# Altium project Tracker-NB-IOT-v1.1.PrjPcb (part 2 of 3)
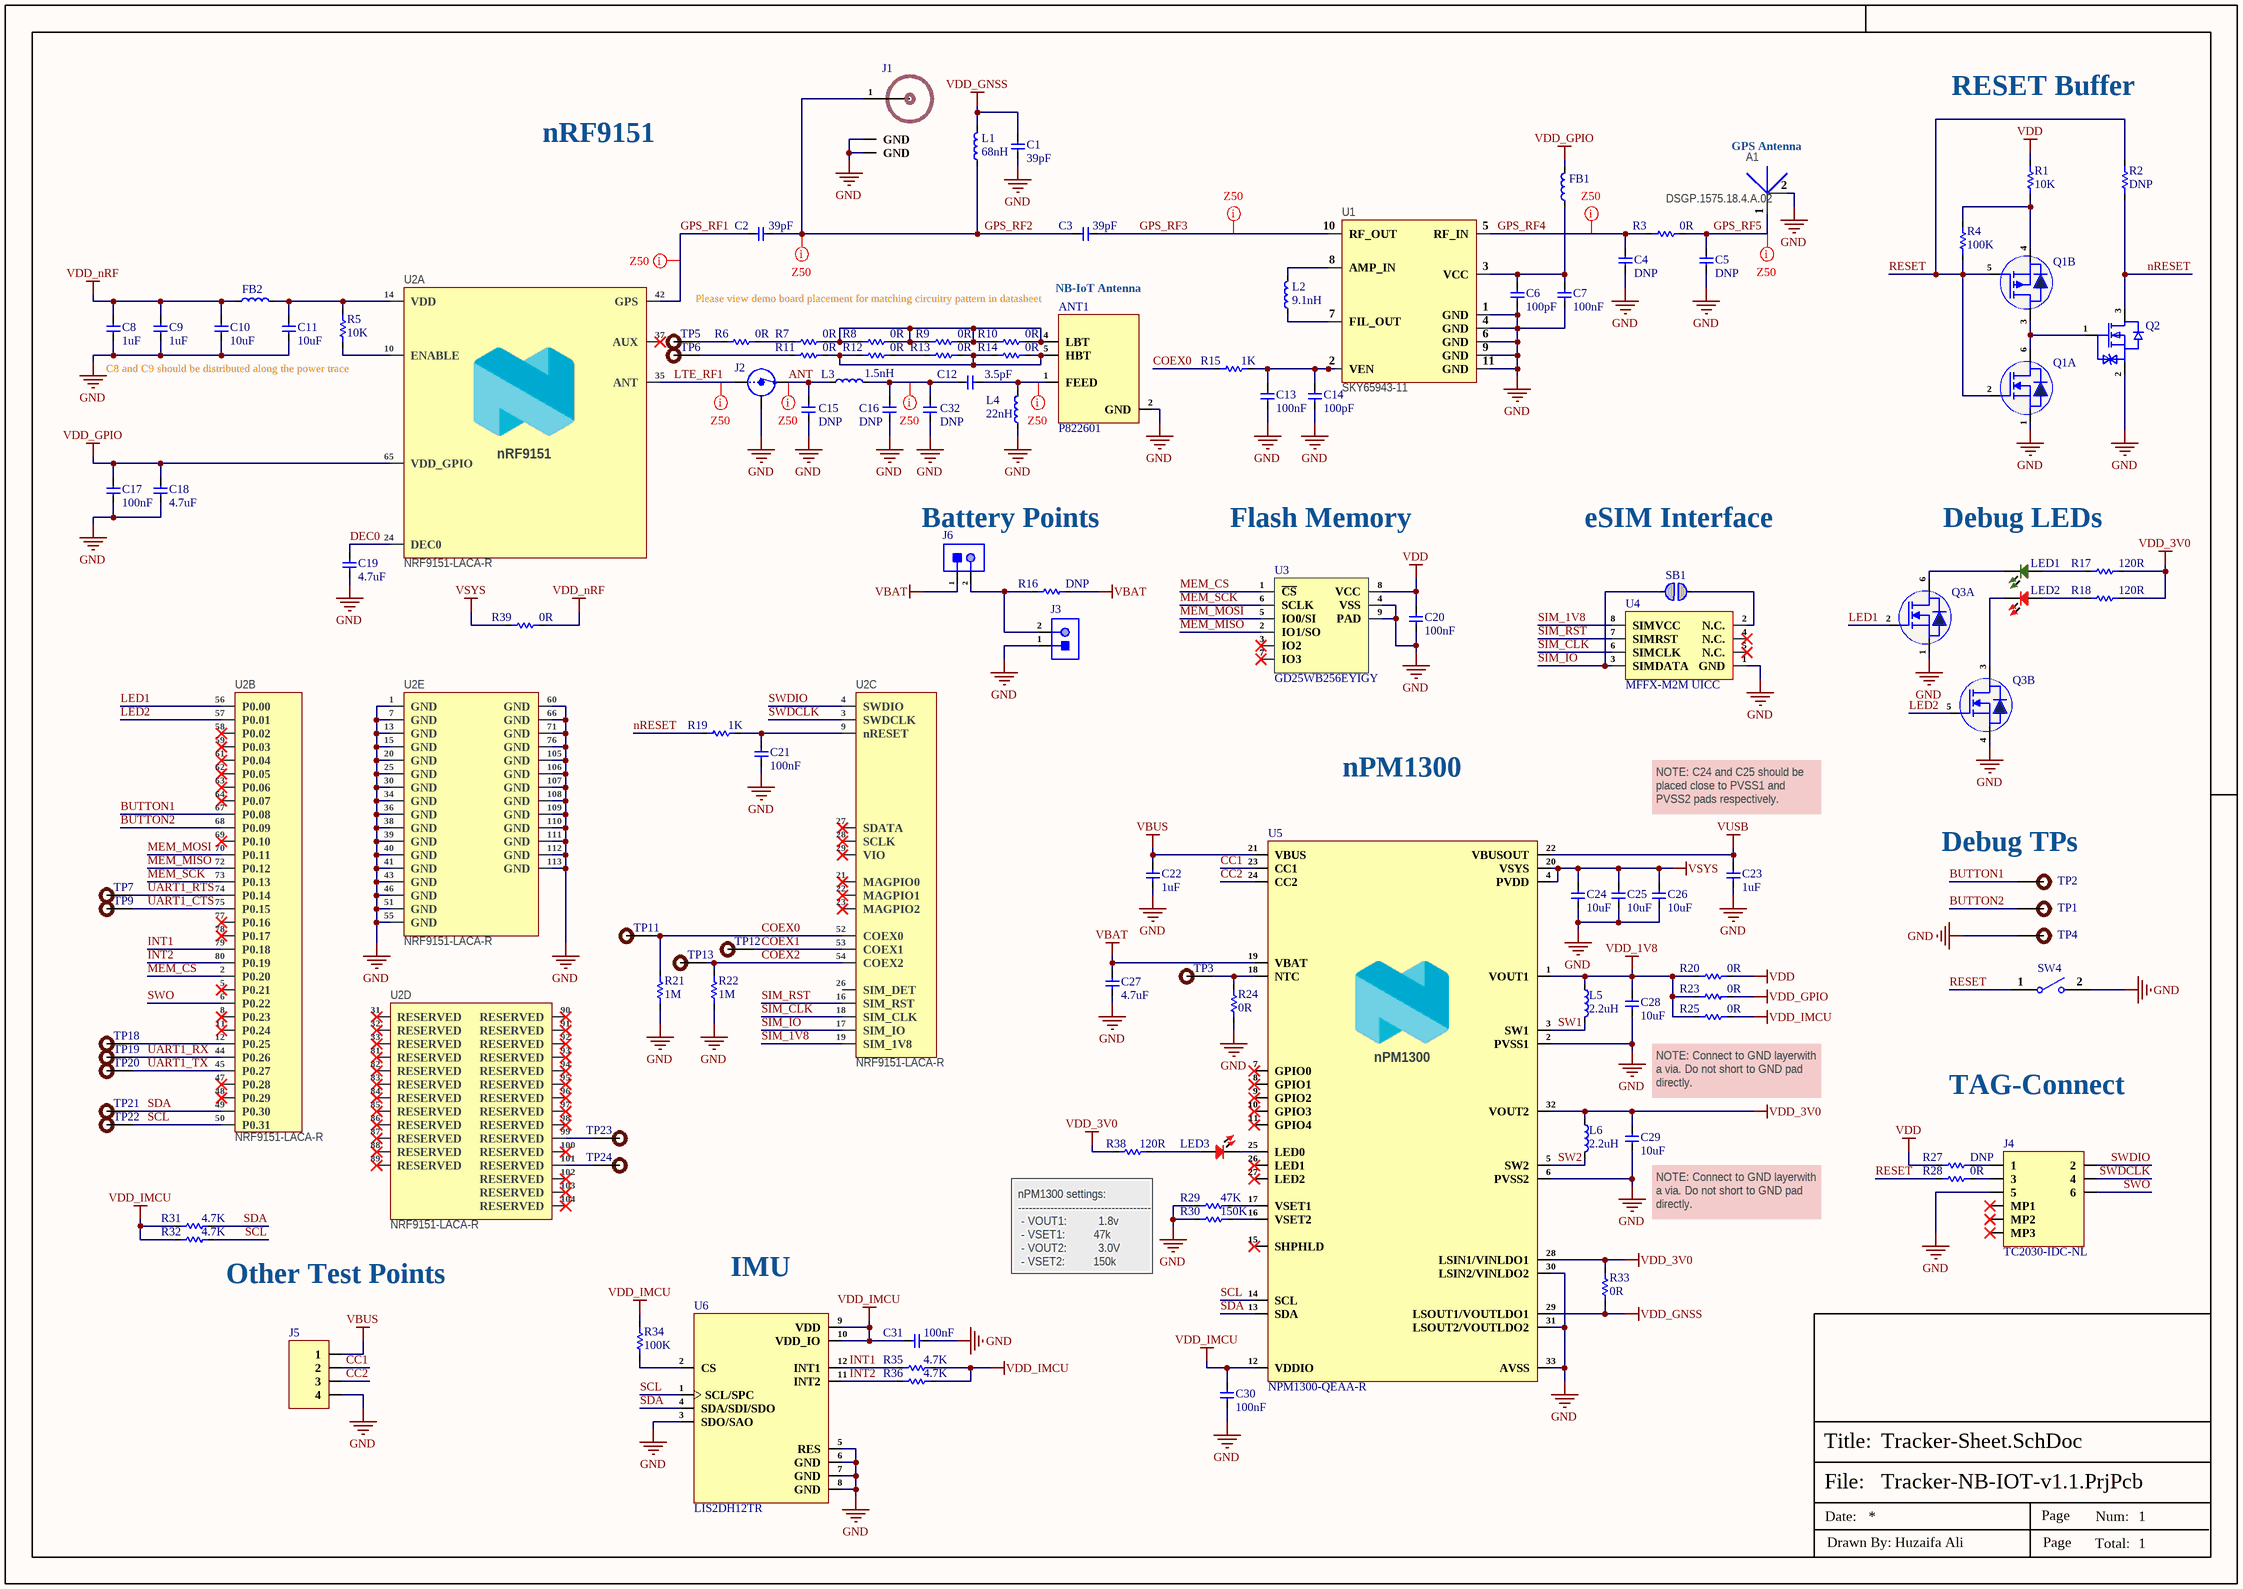
[diagram p1: Tracker-Sheet.SchDoc]

## Sheet Tracker-Sheet.SchDoc (continued)
### Library data of the parts
A1 = DSGP.1575.18.4.A.02: GPS SMT PATCH ANTENNA; Manufacturer: Taoglas; Manufacturer Part Number: DSGP.1575.18.4.C.02; Part number NEMS: 100700073; Component Status: Active; ComponentLink1URL: https://www.taoglas.com/datasheets/DSGP.1575.18.4.A.02.pdf; ComponentLink1Description: Datasheet; ComponentLink2URL: https://www.digikey.com/product-detail/en/taoglas-limited/DSGP.1575.18.4.A.02/931-1511-1-ND/8275289; ComponentLink2Description: Supplier link; Author: rubr; PartId: 100700073; Item Type: ANTENNA
ANT1 = P822601: RF ANT 700MHZ/750MHZ FLAT BAR; Manufacturer: AVX; Item Type: RF Antennas; Number of Bands: 3NUMBER; Frequency: 2.7GHz; Gain: 3.4dB; Impedance: 50R; Power Rating: 2W; Supplier: Digikey; Manufacturer Part Number: P822601; RoHS: Yes; Stock: 7895; Pricing: 1=5.7, 10=3.826, 25=3.3392, 100=2.7938 (USD); Min Operating Temperature: -40°C; Max Operating Temperature: 85°C; Clock Frequency: 2.7GHz; Height: 3.5mm; ComponentLink1URL: http://www.farnell.com/datasheets/2620174.pdf?src-supplier=Farnell; ComponentLink1Description: http://www.farnell.com/datasheets/2620174.pdf?src-supplier=Farnell; ComponentLink2URL: http://www.farnell.com/datasheets/2620174.pdf?src-supplier=Newark; ComponentLink2Description: http://www.farnell.com/datasheets/2620174.pdf?src-supplier=Newark; ComponentLink3URL: http://www.farnell.com/datasheets/2620174.pdf?src-supplier=Element14; ComponentLink3Description: http://www.farnell.com/datasheets/2620174.pdf?src-supplier=Element14; ComponentLink4URL: https://datasheet.octopart.com/P822601-KYOCERA-AVX-datasheet-165822267.pdf?src-supplier=Future+Electronics; ComponentLink4Description: https://datasheet.octopart.com/P822601-KYOCERA-AVX-datasheet-165822267.pdf?src-supplier=Future+Electronics
C1-C5 = CC0402FRNPO9BN390: CAP CER 39PF 50V C0G/NPO 0402; Manufacturer: Yageo; Item Type: Capacitor; Supplier: Future Electronics; Supplier Part Number: 7829161; Manufacturer Part Number: CC0402FRNPO9BN390; RoHS: Yes; Category: Ceramic Capacitors; Stock: 40000; Pricing: 10000=0.0077, 30000=0.0074, 50000=0.0072, 150000=0.0069, 250000=0.0067 (USD); ComponentLink1URL: https://datasheet.ciiva.com/26936/getdatasheetpartid-403444-26936051.pdf?src-supplier=Verical; ComponentLink1Description: https://datasheet.ciiva.com/26936/getdatasheetpartid-403444-26936051.pdf?src-supplier=Verical; ComponentLink2URL: https://datasheet.ciiva.com/11587/upy-gp-np0-16v-to-50v-8-11587062.pdf?src-supplier=Avnet; ComponentLink2Description: https://datasheet.ciiva.com/11587/upy-gp-np0-16v-to-50v-8-11587062.pdf?src-supplier=Avnet; LCSC Part Number: C327068
C6 C14 = CC0201GRNPO9BN101: CAP CER 100PF 50V C0G/NPO 0201; Manufacturer: Yageo; Item Type: Capacitors; Supplier: Digikey; LCSC Part Number: C541242; Manufacturer Part Number: CC0201GRNPO9BN101; RoHS: No; Stock: 97329; Pricing: 1=0.1, 10=0.027, 50=0.0156, 100=0.0122, 500=0.00916, 1000=0.00719, 2500=0.00654, 5000=0.00602 (USD)
C7 C13 C17 C20 C21 C30 C31 = CC0201KRX5R6BB104: CAP CER 0.1UF 10V X5R 0201; Manufacturer: Yageo; Tolerance: 10%; Supplier 1: Mouser; Manufacturer Part Number: CC0201KRX5R6BB104; RoHS: Yes; Category: Ceramic Capacitors; Stock 1: 824403; Pricing 1: 1=0.10000, 10=0.02400, 50=0.02400, 100=0.01900, 1000=0.01100, 10000=0.00900 (USD); Mount: Surface Mount; Case/Package: 0201; Case Code (Imperial): 0201; Case Code (Metric): 0603; Weight: 6E-06oz; Min Operating Temperature: -55°C; Max Operating Temperature: 85°C; Capacitance: 100nF; Dielectric: X5R; Voltage Rating (DC): 10V; Packaging: Tape and Reel; Termination: SMD/SMT; Resistor Type: Ceramic; Voltage Rating: 10V; Series: CC; Construction: Flat; Length: 0.6mm; Width: 0.012inch; Height: 0.3mm; Thickness: 0.013inch; Depth: 0.3mm; Radiation Hardening: No; Lead Free: Lead Free; Halogen Free: Halogen Free; RoHS Compliant: Yes; ComponentLink1URL: https://datasheet.ciiva.com/11587/upy-gphc-x5r-4v-to-50v-12-11587190.pdf?src-supplier=Avnet; ComponentLink1Description: https://datasheet.ciiva.com/11587/upy-gphc-x5r-4v-to-50v-12-11587190.pdf?src-supplier=Avnet; Supplier Part Number 1: 603-CC201KRX5R6BB104; LCSC Part Number: C190183
C8 C9 C22 C23 = CC0201MRX5R6BB105: CAP CER 1UF 10V X5R 0201; Manufacturer: Yageo; Item Type: Capacitor; Supplier: Digi-Key; Supplier Part Number: 311-3474-1-ND; Manufacturer Part Number: CC0201MRX5R6BB105; RoHS: Yes; Category: Ceramic Capacitors; Stock: 772400; Pricing: 1=0.19, 10=0.135, 50=0.0764, 100=0.0633, 500=0.04436, 1000=0.03672, 2500=0.03418, 5000=0.03127 (USD); ComponentLink1URL: https://datasheet.octopart.com/CC0201MRX5R6BB105-Yageo-datasheet-158238148.pdf?src-supplier=Farnell; ComponentLink1Description: https://datasheet.octopart.com/CC0201MRX5R6BB105-Yageo-datasheet-158238148.pdf?src-supplier=Farnell; ComponentLink2URL: http://www.yageo.com/documents/recent/UPY-GPHC_X5R_4V-to-50V_25.pdf?src-supplier=Digi-Key; ComponentLink2Description: http://www.yageo.com/documents/recent/UPY-GPHC_X5R_4V-to-50V_25.pdf?src-supplier=Digi-Key; ComponentLink3URL: https://datasheet.octopart.com/CC0201MRX5R6BB105-Yageo-datasheet-137700082.pdf?src-supplier=Future+Electronics; ComponentLink3Description: https://datasheet.octopart.com/CC0201MRX5R6BB105-Yageo-datasheet-137700082.pdf?src-supplier=Future+Electronics; LCSC Part Number: C605210
C10 C11 C24-C26 C28 C29 = GRM188Z71A106KA73D: CAP CER 10UF 10V X7R 0603; Manufacturer: Murata; Item Type: Capacitor; Material: 4241ConductorMaterial; Tolerance: 10%; Supplier: Mouser; LCSC Part Number: C2959727; Manufacturer Part Number: GRM188Z71A106KA73D; RoHS: Yes; Stock: 390983; Pricing: 1=0.36, 10=0.155, 50=0.155, 100=0.104, 1000=0.094, 10000=0.065 (USD); Case/Package: 345Case; Min Operating Temperature: -55°C; Max Operating Temperature: 125°C; Value: 10uF; Voltage Rating: 10V; Length: 1.6mm; Width: 800um; Height: 1mm; Thickness: 800um; RoHS Compliant: Yes; ComponentLink1URL: https://datasheet.octopart.com/GRM188Z71A106KA73D-Murata-datasheet-165579666.pdf?src-supplier=TME; ComponentLink1Description: https://datasheet.octopart.com/GRM188Z71A106KA73D-Murata-datasheet-165579666.pdf?src-supplier=TME
C12 = GJM0335C1H3R5BB01D: CAP CER 3.5PF 50V C0G/NP0 0201; Manufacturer: Murata; Item Type: Capacitor; Supplier: Mouser; Supplier Part Number: 81-GJM0335C1H3R5BB1D; Manufacturer Part Number: GJM0335C1H3R5BB01D; RoHS: Yes; Stock: 31816; Pricing: 1=0.1, 10=0.032, 50=0.032, 100=0.019, 1000=0.015, 10000=0.012 (USD); ComponentLink1URL: https://search.murata.co.jp/Ceramy/image/img/A01X/G101/ENG/GJM0335C1H3R5BB01-01.pdf?src-supplier=Digikey; ComponentLink1Description: https://search.murata.co.jp/Ceramy/image/img/A01X/G101/ENG/GJM0335C1H3R5BB01-01.pdf?src-supplier=Digikey
C15 C16 C32 = GCM0335C1E560JA16D: CAP CER 56PF 25V C0G/NP0 0201; Manufacturer: Murata; Item Type: Capacitors; Supplier: Mouser; Manufacturer Part Number: GCM0335C1E560JA16D; RoHS: Yes; Stock: 29000; Pricing: 1=0.1, 10=0.014, 50=0.014, 100=0.008, 1000=0.007, 10000=0.005 (USD); LCSC Part Number: C5119324
C18 C19 C27 = CC0402KRX5R6BB475: CAP CER 4.7UF 10V X5R 0402; Manufacturer: Yageo; Tolerance: 10%; Supplier 1: Farnell; Manufacturer Part Number: CC0402KRX5R6BB475; RoHS: Yes; Category: Ceramic Capacitors; Stock 1: 20000; Pricing 1: 10000=0.02310, 50000=0.02100 (GBP); Mount: Surface Mount; Case/Package: 0402; Case Code (Imperial): 0402; Case Code (Metric): 1005; Min Operating Temperature: -55°C; Max Operating Temperature: 85°C; Packaging: Cut Tape; Capacitance: 4.7uF; Voltage Rating: 10V; RoHS Compliant: Yes; ComponentLink1URL: http://www.yageo.com/documents/recent/UPY-GPHC_X5R_4V-to-50V_25.pdf?src-supplier=Digi-Key; ComponentLink1Description: http://www.yageo.com/documents/recent/UPY-GPHC_X5R_4V-to-50V_25.pdf?src-supplier=Digi-Key; Supplier Part Number 1: 3871698; LCSC Part Number: C326586
FB1 = BLM15EX121SN1D: FERRITE BEAD 120 OHM 0402 1LN; Manufacturer: Murata; Item Type: Ferrite Beads; Number of Lines: 1; Max Current Rating: 1.8A; Supplier: Mouser; LCSC Part Number: C426325; Manufacturer Part Number: BLM15EX121SN1D; RoHS: Yes; Stock: 26843; Pricing: 1=0.17, 10=0.089, 50=0.089, 100=0.062, 1000=0.045, 10000=0.039 (USD); Mounting Technology: Surface Mount; Case/Package: 0402; Case Code (Imperial): 0402; Case Code (Metric): 1005; Min Operating Temperature: -55°C; Max Operating Temperature: 125°C; Packaging: Cut Tape; Series: EMIFIL®, BLM15; RoHS Compliant: Yes; ComponentLink1URL: https://www.murata.com/en-us/products/productdata/8796750970910/ENFA0023.pdf?src-supplier=Digikey; ComponentLink1Description: https://www.murata.com/en-us/products/productdata/8796750970910/ENFA0023.pdf?src-supplier=Digikey
FB2 = BLM18SD220SN1D: FERRITE BEAD 22 OHM 0603 1LN; Manufacturer: Murata; Item Type: Ferrite Beads; Number of Lines: 1; Max Current Rating: 6A; Supplier: Mouser; Supplier Part Number: 81-BLM18SD220SN1D; Manufacturer Part Number: BLM18SD220SN1D; RoHS: Yes; Stock: 11187; Pricing: 1=0.16, 10=0.093, 50=0.093, 100=0.064, 1000=0.047, 10000=0.04 (USD); Mounting Technology: Surface Mount; Case/Package: 0603; Case Code (Imperial): 0603; Case Code (Metric): 1608; Min Operating Temperature: -55°C; Max Operating Temperature: 125°C; Packaging: Cut Tape; Series: BLM; RoHS Compliant: Yes; ComponentLink1URL: https://www.murata.com/en-us/products/productdata/8796738650142/ENFA0003.pdf?src-supplier=Digikey; ComponentLink1Description: https://www.murata.com/en-us/products/productdata/8796738650142/ENFA0003.pdf?src-supplier=Digikey
J1 = U.FL-R-SMT-1(80): CONN U.FL RCPT STR 50 OHM SMD; Manufacturer: Hirose; Item Type: UFL Connector; Supplier 1: Future Electronics; Manufacturer Part Number: U.FL-R-SMT-1(80); Stock 1: 1272; Pricing 1: 1=1.07, 500=0.785, 1500=0.74, 2500=0.72, 5000=0.695 (USD); Case/Package: SMD/SMT; Package Quantity: 10000; Packaging: Tape and Reel; Lead Free: Lead Free; ComponentLink1URL: https://www.hirose.com/product/en/download_file/key_name/U.FL-R-SMT-1%2880%29/category/Specification%20Sheet/doc_file_id/37638/?file_category_id=9&item_id=03310472280&is_series=&src-supplier=Digi-Key; ComponentLink1Description: https://www.hirose.com/product/en/download_file/key_name/U.FL-R-SMT-1%2880%29/category/Specification%20Sheet/doc_file_id/37638/?file_category_id=9&item_id=03310472280&is_series=&src-supplier=Digi-Key; ComponentLink2URL: http://www.mouser.com/ds/2/185/U.FL_catalog-939761.pdf?src-supplier=Mouser; ComponentLink2Description: http://www.mouser.com/ds/2/185/U.FL_catalog-939761.pdf?src-supplier=Mouser; Supplier Part Number 1: U.FL-R-SMT-1(80)-CUTT; LCSC Part Number: C88374
J2 = MM8130-2600RA2: CONN SWF RCPT STR 50 OHM SMD; Manufacturer: Murata; Item Type: RF / Coaxial Connectors; Supplier: Future Electronics; LCSC Part Number: C167503; Manufacturer Part Number: MM8130-2600RA2; RoHS: Yes; Stock: 262000; Pricing: 2000=0.121, 6000=0.118, 8000=0.117, 20000=0.114, 30000=0.111 (USD); ComponentLink1URL: https://datasheet.ciiva.com/13541/mm8130-260020datasheet-202944-13541575.pdf?src-supplier=Mouser; ComponentLink1Description: https://datasheet.ciiva.com/13541/mm8130-260020datasheet-202944-13541575.pdf?src-supplier=Mouser; ComponentLink2URL: https://datasheet.ciiva.com/14157/04615200-1-14157602.pdf?src-supplier=Distrelec; ComponentLink2Description: https://datasheet.ciiva.com/14157/04615200-1-14157602.pdf?src-supplier=Distrelec; ComponentLink3URL: https://datasheet.ciiva.com/16465/l0391e-16465766.pdf?src-supplier=Future+Electronics; ComponentLink3Description: https://datasheet.ciiva.com/16465/l0391e-16465766.pdf?src-supplier=Future+Electronics
J3 = X6511WV-02H-C60D30: Gold 250V 3A Straight Square Pins 2.5mm 2P 260℃ 6mm -40℃~+105℃ 3mm 2.54mm Plugin Black Brass 1x2P Plugin,P=2.54mm Pin Headers ROHS; Manufacturer: XKB; Item Type: Male Header; Manufacturer Part Number: X6511WV-02H-C60D30; Package: Plugin,P=2.54mm; LCSC Part Number: C706874; ComponentLink1Description: LCSC; ComponentLink1URL: https://www.lcsc.com/product-detail/Pin-Headers_XKB-Connectivity-X6511WV-02H-C60D30_C706874.html
J5 = POGO Connector 4 Pin: Pogo Pad 2.5mm 4 Pin; Item Type: Pogo Connector; Manufacturer Part Number: POGO Connector 4 Pin
J6 = 1.27-1*2P: 3A Direct Insert Policy 1.7mm 2P 3mm -55℃~+105℃ 2.5mm 1.27mm Single Row Black Brass 1x2P Plugin,P=1.27mm Pin Headers ROHS; Manufacturer: BOOMELE(BOOM Precision Elec); Item Type: Male; Manufacturer Part Number: 1.27-1*2P; Package: Plugin,P=1.27mm; LCSC Part Number: C703015; ComponentLink1Description: LCSC; ComponentLink1URL: https://www.lcsc.com/product-detail/Pin-Headers_BOOMELE-Boom-Precision-Elec-1-27-1-2P_C703015.html
L1 = LQW15AN68NG00D: FIXED IND 68NH 140MA 1.96OHM SMD; Manufacturer: Murata; Item Type: Inductor; Core Material: Non-Magnetic,Air,Ferrite; Tolerance: 2%; DC Resistance (DCR): 1.96R; Shielding: Unshielded; Q Factor: 20; Self Resonant Frequency: 2.5GHz; Test Frequency: 100MHz; Current: 570mA; Supplier: Future Electronics; LCSC Part Number: C108965; Manufacturer Part Number: LQW15AN68NG00D; RoHS: Yes; Stock: 10000; Pricing: 10000=0.0443, 20000=0.0432, 30000=0.0426, 40000=0.0422, 50000=0.0408 (USD); Mounting Technology: Surface Mount; Case/Package: 0402; Pins: 2; Weight: 2.8E-05oz; Case Code (Metric): 1005; Case Code (Imperial): 0402; Min Operating Temperature: -55°C; Max Operating Temperature: 125°C; Value: 68nH; Max DC Current: 140mA; Package Quantity: 1; Packaging: Tape and Reel; Inductance Tolerance: 2%; Termination: SMD/SMT; DC Current: 140mA; Series: LQW15A_00; RMS Current (Irms): 140mA; ESR: 1.96R; Length: 1mm; Width: 0.5mm; Height: 0.5mm; Depth: 0.6mm; Radiation Hardening: No; Reach SVHC Compliant: No; Military Standard: Not; Lead Free: Lead Free; RoHS Compliant: Yes; ComponentLink1URL: https://datasheet.ciiva.com/11799/0900766b8090d800-11799373.pdf?src-supplier=Rs; ComponentLink1Description: https://datasheet.ciiva.com/11799/0900766b8090d800-11799373.pdf?src-supplier=Rs; ComponentLink2URL: https://datasheet.ciiva.com/36857/460962-36857115.pdf?src-supplier=Element14; ComponentLink2Description: https://datasheet.ciiva.com/36857/460962-36857115.pdf?src-supplier=Element14; ComponentLink3URL: https://datasheet.ciiva.com/6709/l0075s0080lqw15a-00-6709896.pdf?src-supplier=Digikey; ComponentLink3Description: https://datasheet.ciiva.com/6709/l0075s0080lqw15a-00-6709896.pdf?src-supplier=Digikey; ComponentLink4URL: https://datasheet.ciiva.com/6709/l0075s0080lqw15a-00-6709895.pdf?src-supplier=Digikey; ComponentLink4Description: https://datasheet.ciiva.com/6709/l0075s0080lqw15a-00-6709895.pdf?src-supplier=Digikey; ComponentLink5URL: https://datasheet.ciiva.com/6709/l0075s0080lqw15a-00-6709898.pdf?src-supplier=Digikey; ComponentLink5Description: https://datasheet.ciiva.com/6709/l0075s0080lqw15a-00-6709898.pdf?src-supplier=Digikey; ComponentLink6URL: https://datasheet.ciiva.com/8508/l0075s0080lqw15a-00-8508445.pdf?src-supplier=Avnet; ComponentLink6Description: https://datasheet.ciiva.com/8508/l0075s0080lqw15a-00-8508445.pdf?src-supplier=Avnet
L2 = LQW15AN9N1G00D: FIXED IND 9.1NH 540MA 0.14OHM SM; Manufacturer: Murata; Item Type: nductors; Supplier: Future Electronics; LCSC Part Number: C113122; Manufacturer Part Number: LQW15AN9N1G00D; RoHS: Yes; Stock: 200000; Pricing: 10000=0.0438, 20000=0.0428, 30000=0.0422, 40000=0.0418, 50000=0.0404 (USD); ComponentLink1URL: https://datasheet.ciiva.com/11799/0900766b8090d800-11799088.pdf?src-supplier=Rs; ComponentLink1Description: https://datasheet.ciiva.com/11799/0900766b8090d800-11799088.pdf?src-supplier=Rs; ComponentLink2URL: https://datasheet.ciiva.com/6709/l0075s0080lqw15a-00-6709884.pdf?src-supplier=Digikey; ComponentLink2Description: https://datasheet.ciiva.com/6709/l0075s0080lqw15a-00-6709884.pdf?src-supplier=Digikey; ComponentLink3URL: https://datasheet.ciiva.com/6709/l0075s0080lqw15a-00-6709886.pdf?src-supplier=Digikey; ComponentLink3Description: https://datasheet.ciiva.com/6709/l0075s0080lqw15a-00-6709886.pdf?src-supplier=Digikey; ComponentLink4URL: https://datasheet.ciiva.com/4978/product-4978396.pdf?src-supplier=Mouser; ComponentLink4Description: https://datasheet.ciiva.com/4978/product-4978396.pdf?src-supplier=Mouser; ComponentLink5URL: https://datasheet.ciiva.com/16455/l0075s0080lqw15a-00-16455836.pdf?src-supplier=Future+Electronics; ComponentLink5Description: https://datasheet.ciiva.com/16455/l0075s0080lqw15a-00-16455836.pdf?src-supplier=Future+Electronics
L3 = LQP03HQ1N5B02D: FIXED IND 1.5NH 1A 50 MOHM SMD; Manufacturer: Murata; Item Type: Inductor; Q Factor: 20NUMBER; Value: 50mR; Supplier: Mouser; LCSC Part Number: C2041489; Manufacturer Part Number: LQP03HQ1N5B02D; RoHS: Yes; Stock: 37991; Pricing: 1=0.16, 10=0.104, 50=0.104, 100=0.081, 1000=0.065, 10000=0.057 (USD); RMS Current (Irms): 1A; ESR: 50mR; Height: 420um; ComponentLink1URL: http://www.farnell.com/datasheets/2616670.pdf?src-supplier=Farnell; ComponentLink1Description: http://www.farnell.com/datasheets/2616670.pdf?src-supplier=Farnell; ComponentLink2URL: https://search.murata.co.jp/Ceramy/image/img/P02/JELF243C-0021.pdf?src-supplier=Digikey; ComponentLink2Description: https://search.murata.co.jp/Ceramy/image/img/P02/JELF243C-0021.pdf?src-supplier=Digikey; ComponentLink3URL: http://search.murata.co.jp/Ceramy/image/img/P02/JELF243C-0021.pdf?src-supplier=Digikey; ComponentLink3Description: http://search.murata.co.jp/Ceramy/image/img/P02/JELF243C-0021.pdf?src-supplier=Digikey; ComponentLink4URL: https://datasheet.octopart.com/LQP03HQ1N5B02D-Murata-datasheet-68295820.pdf?src-supplier=Future+Electronics; ComponentLink4Description: https://datasheet.octopart.com/LQP03HQ1N5B02D-Murata-datasheet-68295820.pdf?src-supplier=Future+Electronics; ComponentLink5URL: http://www.farnell.com/datasheets/2616670.pdf?src-supplier=Newark; ComponentLink5Description: http://www.farnell.com/datasheets/2616670.pdf?src-supplier=Newark
L4 = LQP03HQ22NH02D: FIXED IND 22NH 250MA 820MOHM SMD; Manufacturer: Murata; Item Type: Inductors; Supplier: Mouser; LCSC Part Number: C1329450; Manufacturer Part Number: LQP03HQ22NH02D; RoHS: Yes; Stock: 18723; Pricing: 1=0.11, 10=0.072, 50=0.072, 100=0.056, 1000=0.046, 10000=0.045 (USD); ComponentLink1URL: https://datasheet.octopart.com/LQP03HQ22NH02D-Murata-datasheet-140317290.pdf?src-supplier=Farnell; ComponentLink1Description: https://datasheet.octopart.com/LQP03HQ22NH02D-Murata-datasheet-140317290.pdf?src-supplier=Farnell; ComponentLink2URL: https://search.murata.co.jp/Ceramy/image/img/P02/JELF243C-0021.pdf?src-supplier=Digikey; ComponentLink2Description: https://search.murata.co.jp/Ceramy/image/img/P02/JELF243C-0021.pdf?src-supplier=Digikey; ComponentLink3URL: http://search.murata.co.jp/Ceramy/image/img/P02/JELF243C-0021.pdf?src-supplier=Digikey; ComponentLink3Description: http://search.murata.co.jp/Ceramy/image/img/P02/JELF243C-0021.pdf?src-supplier=Digikey; ComponentLink4URL: https://datasheet.octopart.com/LQP03HQ22NH02D-Murata-datasheet-68295820.pdf?src-supplier=Future+Electronics; ComponentLink4Description: https://datasheet.octopart.com/LQP03HQ22NH02D-Murata-datasheet-68295820.pdf?src-supplier=Future+Electronics; ComponentLink5URL: https://datasheet.octopart.com/LQP03HQ22NH02D-Murata-datasheet-142046015.pdf?src-supplier=Arrow.cn; ComponentLink5Description: https://datasheet.octopart.com/LQP03HQ22NH02D-Murata-datasheet-142046015.pdf?src-supplier=Arrow.cn
L5 L6 = CIGT201610EH2R2MNE: FIXED IND 2.2UH 2.5A 87MOHM SMD; Manufacturer: Samsung; Item Type: Inductor; Core Material: Metal,Composite; Tolerance: 20%; Saturation Current: 2.9A; Shielding: Unshielded; DC Resistance (DCR): 87mR; Test Frequency: 1MHz; Supplier: Arrow Electronics; Supplier Part Number: CIGT201610EH2R2MNE; Manufacturer Part Number: CIGT201610EH2R2MNE; RoHS: Yes; Stock: 6000; Pricing: 60000=0.0753, 99000=0.0745 (USD); Mounting Technology: Surface Mount; Case/Package: 0806; Case Code (Imperial): 0806; Case Code (Metric): 2016; Min Operating Temperature: -40°C; Max Operating Temperature: 125°C; Packaging: Cut Tape; Value: 2.2uH; Series: CIGT; RoHS Compliant: Yes; ComponentLink1URL: http://www.samsungsem.com/kr/support/product-search/inductor/CIGT201610EH2R2MNE.jsp?src-supplier=Digikey; ComponentLink1Description: http://www.samsungsem.com/kr/support/product-search/inductor/CIGT201610EH2R2MNE.jsp?src-supplier=Digikey
LED1 = XZVG68W-2: LED GREEN CLEAR CHIP SMD; Manufacturer: SunLED; Lens Color: Colorless; Luminous Intensity: 49mcd; Test Current: 20mA; Viewing Angle: 120°; Dominant Wavelength: 570nm; Forward Voltage: 2.1V; Manufacturer Part Number: XZVG68W-2; Item Type: LED; ComponentLink1Description: http://www.sunledusa.com/products/spec/XZVG68W-2.pdf?src-supplier=Digi-Key; ComponentLink1URL: http://www.sunledusa.com/products/spec/XZVG68W-2.pdf?src-supplier=Digi-Key; Supplier 1: Digi-Key; Stock 1: 4185; Pricing 1: 1=0.5, 10=0.36, 100=0.16, 500=0.112, 1000=0.092 (USD); Mount: Surface Mount; Case/Package: 0402; Color: Green; Case Code (Metric): 1005; Case Code (Imperial): 0402; Packaging: Tape and Reel; Lens Transparency: Clear; Length: 1mm; Height: 0.6mm; Width: 0.5mm; ComponentLink2URL: https://www.sunledusa.com/products/spec/XZVG68W-2.pdf?src-supplier=Digi-Key; ComponentLink2Description: https://www.sunledusa.com/products/spec/XZVG68W-2.pdf?src-supplier=Digi-Key; Supplier Part Number 1: 1497-1219-6-ND
LED2 LED3 = XZMDK68W-2: LED RED CLEAR CHIP SMD; Manufacturer: SunLED; Lens Color: Colorless; Luminous Intensity: 69mcd; Test Current: 20mA; Viewing Angle: 120°; Dominant Wavelength: 630nm; Forward Voltage: 1.95V; Manufacturer Part Number: XZMDK68W-2; Item Type: LED; ComponentLink1Description: http://www.sunledusa.com/products/spec/XZMDK68W-2.pdf?src-supplier=Digi-Key; ComponentLink1URL: http://www.sunledusa.com/products/spec/XZMDK68W-2.pdf?src-supplier=Digi-Key; Supplier 1: Digi-Key; Stock 1: 69539; Pricing 1: 1=0.43, 10=0.306, 100=0.136, 500=0.0952, 1000=0.0782 (USD); Mount: Surface Mount; Case/Package: 0402; Color: Red; Case Code (Metric): 1005; Case Code (Imperial): 0402; Packaging: Tape and Reel; Lens Transparency: Clear; Length: 1mm; Height: 0.6mm; Width: 0.5mm; ComponentLink2URL: https://www.sunledusa.com/products/spec/XZMDK68W-2.pdf?src-supplier=Digi-Key; ComponentLink2Description: https://www.sunledusa.com/products/spec/XZMDK68W-2.pdf?src-supplier=Digi-Key; Supplier Part Number 1: 1497-1174-6-ND
Q1 = DMC2400UV-7: MOSFET N/P-CH 20V SOT563; Manufacturer: Diodes; Item Type: MOSFETs; Max Power Dissipation: 450mW; Rds On Max: 480mR; Input Capacitance: 37.1pF; Continuous Drain Current (ID): 1.03A; Turn-Off Delay Time: 13.74ns; Turn-On Delay Time: 4.06ns; FET Type: N and P-Channel; Drain-source On Resistance-Max: 970mR; Supplier: Future Electronics; LCSC Part Number: 8027555; Manufacturer Part Number: DMC2400UV-7; RoHS: Yes; Stock: 207000; Pricing: 3000=0.0517, 9000=0.0497, 12000=0.0492, 30000=0.0476, 45000=0.046 (USD); Mounting Technology: Surface Mount; Case/Package: SOT-563; Pins: 6; Min Operating Temperature: -55°C; Max Operating Temperature: 150°C; Packaging: Tape and Reel; Drain to Source Voltage (Vdss): 20V; Series: -; Length: 1.7mm; Width: 1.25mm; Height: 0.6mm; Radiation Hardening: No; RoHS Compliant: Yes; Lead Free: Lead Free; Reach SVHC Compliant: Yes; ComponentLink1URL: https://datasheet.ciiva.com/11176/dmc2400uv-11176335.pdf?src-supplier=Avnet; ComponentLink1Description: https://datasheet.ciiva.com/11176/dmc2400uv-11176335.pdf?src-supplier=Avnet
Q2 = RV2C010UNT2L: MOSFET N-CH 20V 1A DFN1006-3; Manufacturer: Rohm; Item Type: MOSFETs; Drain to Source Resistance: 340mR; Supplier: Mouser; LCSC Part Number: C570828; Manufacturer Part Number: RV2C010UNT2L; RoHS: Yes; Stock: 16470; Pricing: 1=0.42, 10=0.261, 50=0.261, 100=0.123, 1000=0.086, 10000=0.073 (USD); ComponentLink1URL: http://www.mouser.com/ds/2/348/rv2c010un-e-1139137.pdf?src-supplier=Mouser; ComponentLink1Description: http://www.mouser.com/ds/2/348/rv2c010un-e-1139137.pdf?src-supplier=Mouser; ComponentLink2URL: http://www.farnell.com/datasheets/1945594.pdf?src-supplier=Farnell; ComponentLink2Description: http://www.farnell.com/datasheets/1945594.pdf?src-supplier=Farnell; ComponentLink3URL: https://www.rohm.com/datasheet/RV2C010UN/rv2c010un-e?src-supplier=Digikey; ComponentLink3Description: https://www.rohm.com/datasheet/RV2C010UN/rv2c010un-e?src-supplier=Digikey; ComponentLink4URL: http://rohmfs.rohm.com/en/techdata_basic/transistor/taping/VML1006_T2L_taping.pdf?src-supplier=Digikey; ComponentLink4Description: http://rohmfs.rohm.com/en/techdata_basic/transistor/taping/VML1006_T2L_taping.pdf?src-supplier=Digikey; ComponentLink5URL: http://rohmfs.rohm.com/en/products/databook/datasheet/discrete/transistor/mosfet/rv2c010unt2l.pdf?src-supplier=Avnet; ComponentLink5Description: http://rohmfs.rohm.com/en/products/databook/datasheet/discrete/transistor/mosfet/rv2c010unt2l.pdf?src-supplier=Avnet; ComponentLink6URL: https://datasheet.octopart.com/RV2C010UNT2L-Rohm-datasheet-57364635.pdf?src-supplier=Element14; ComponentLink6Description: https://datasheet.octopart.com/RV2C010UNT2L-Rohm-datasheet-57364635.pdf?src-supplier=Element14
Q3 = UM6X1NA-TP: MOSFET 2N-CH 30V 0.5A SOT563; Manufacturer: MCC; Supplier: Digikey; Supplier Part Number: 353-UM6X1NA-TPCT-ND; Manufacturer Part Number: UM6X1NA-TP; RoHS: No; Item Type: Mosfet; Stock: 4780; Pricing: 1=0.29, 10=0.203, 100=0.1284, 500=0.08108, 1000=0.06082 (USD)
R1 R5 = RC0201FR-0710KL: RES SMD 10K OHM 1% 1/20W 0201; Manufacturer: Yageo; Item Type: Resistor; Manufacturer Part Number: RC0201FR-0710KL; Package: 0201; ComponentLink7Description: LCSC; ComponentLink7URL: https://www.lcsc.com/product-detail/Chip-Resistor-Surface-Mount_YAGEO-RC0201FR-0710KL_C106225.html; LCSC Part Number: C106225
R2 R27 = RC0201JR-070RL: RES SMD 0 OHM JUMPER 1/20W 0201; Manufacturer: Yageo; Resistance: 0R; Power Rating: 50mW; Tolerance: 5%; Voltage Rating: 25V; Supplier 1: Digi-Key; Manufacturer Part Number: RC0201JR-070RL; RoHS: Yes; Category: Chip SMD Resistors; Stock 1: 11079; Pricing 1: 1=0.10000, 10=0.03600, 25=0.02640, 50=0.02000, 100=0.01480, 250=0.01128, 500=0.00904, 1000=0.00665, 5000=0.00477 (USD); Case/Package: 0201; Contact Plating: Tin,Matte; Case Code (Metric): 0603; Case Code (Imperial): 0201; Weight: 6E-06oz; Size Code: 0201; Min Operating Temperature: -55°C; Max Operating Temperature: 125°C; Resistor Type: Thick Film; Packaging: Tape and Reel; Package Quantity: 10000; Number of Terminations: 2; Termination: SMD/SMT; Max Power Dissipation: 50mW; Voltage Rating (DC): 25V; Features: Moisture Resistant; Series: RC; Construction: Rectangular; Resistance Tolerance: 5%; Length: 0.6mm; Width: 0.012inch; Height: 0.01inch; Depth: 0.3mm; Radiation Hardening: No; RoHS Compliant: Yes; REACH SVHC: Unknown; Military Standard: Not; Lead Free: Lead Free; ComponentLink1URL: https://datasheet.ciiva.com/7672/1563626-7672247.pdf?src-supplier=Element14; ComponentLink1Description: https://datasheet.ciiva.com/7672/1563626-7672247.pdf?src-supplier=Element14; ComponentLink2URL: https://datasheet.ciiva.com/7660/1421516-7660808.pdf?src-supplier=Element14; ComponentLink2Description: https://datasheet.ciiva.com/7660/1421516-7660808.pdf?src-supplier=Element14; ComponentLink3URL: https://datasheet.ciiva.com/7672/1563626-7672248.pdf?src-supplier=Element14; ComponentLink3Description: https://datasheet.ciiva.com/7672/1563626-7672248.pdf?src-supplier=Element14; ComponentLink4URL: https://datasheet.ciiva.com/16855/pyu-rc0201-51-rohs-l-8-16855994.pdf?src-supplier=Avnet+Europe; ComponentLink4Description: https://datasheet.ciiva.com/16855/pyu-rc0201-51-rohs-l-8-16855994.pdf?src-supplier=Avnet+Europe; ComponentLink5URL: https://datasheet.ciiva.com/28419/pyu-rc0201-51-rohs-l-8-28419660.pdf?src-supplier=Avnet+Europe; ComponentLink5Description: https://datasheet.ciiva.com/28419/pyu-rc0201-51-rohs-l-8-28419660.pdf?src-supplier=Avnet+Europe; ComponentLink6URL: https://datasheet.ciiva.com/46391/1421516-46391340.pdf?src-supplier=Element14; ComponentLink6Description: https://datasheet.ciiva.com/46391/1421516-46391340.pdf?src-supplier=Element14; ComponentLink7URL: https://datasheet.ciiva.com/8896/pyu-rc0201-51-rohs-l-8-8896143.pdf?src-supplier=Avnet; ComponentLink7Description: https://datasheet.ciiva.com/8896/pyu-rc0201-51-rohs-l-8-8896143.pdf?src-supplier=Avnet; Supplier Part Number 1: 311-0.0NCT-ND; LCSC Part Number: C106228
R3 R20 R23 R25 R39 = RC0402FR-070RL: RES 0 OHM JUMPER 1/16W 0402; Manufacturer: Yageo; Item Type: Resistors; Tolerance: 1%; Power Rating: 62.5mW; Voltage Rating: 50V; Temperature Coefficient: 200ppm/°C; Max Power Dissipation: 63mW; Supplier 1: Mouser; Manufacturer Part Number: RC0402FR-070RL; RoHS: Yes; Stock 1: 8556842; Pricing 1: 1=0.10000, 10=0.01400, 50=0.01400, 100=0.00600, 1000=0.00300, 5000=0.00200, 10000=0.00100 (USD); Mount: Surface Mount; Case/Package: 0402; Contact Plating: Tin,Matte; Case Code (Imperial): 0402; Case Code (Metric): 1005; Size Code: 0402; Min Operating Temperature: -55°C; Max Operating Temperature: 155°C; Resistance: 0R; Resistor Type: Thick Film; Packaging: Tape and Reel; Termination: SMD/SMT; Features: Moisture Resistant; Series: RC; Number of Terminations: 2; Length: 1mm; Width: 0.5mm; Height: 0.35mm; Radiation Hardening: No; Lead Free: Lead Free; RoHS Compliant: Yes; ComponentLink1URL: https://datasheet.ciiva.com/8896/pyu-rc0402-51-rohs-l-6-8896149.pdf?src-supplier=Avnet; ComponentLink1Description: https://datasheet.ciiva.com/8896/pyu-rc0402-51-rohs-l-6-8896149.pdf?src-supplier=Avnet; ComponentLink2URL: https://datasheet.ciiva.com/16790/pyu-rc0402-51-rohs-l-6-r-16790444.pdf?src-supplier=Future+Electronics; ComponentLink2Description: https://datasheet.ciiva.com/16790/pyu-rc0402-51-rohs-l-6-r-16790444.pdf?src-supplier=Future+Electronics; Supplier Part Number 1: 603-RC0402FR-070RL; LCSC Part Number: C106231
R4 R34 = RC0201FR-07100KL: RES 100K OHM 1% 1/20W 0201; Manufacturer: Yageo; Resistance: 100kR; Temperature Coefficient: 200ppm/°C; Power Rating: 50mW; Voltage Rating: 25V; Item Type: Resistor; Supplier 1: Digi-Key; Manufacturer Part Number: RC0201FR-07100KL; RoHS: Yes; Category: Chip SMD Resistors; Stock 1: 6740592; Pricing 1: 1=0.10000, 10=0.03900, 100=0.01570, 1000=0.00705, 2500=0.00612, 5000=0.00506 (USD); Case/Package: 0201; Number of Pins: 2; Contact Plating: Tin,Matte; Case Code (Imperial): 0201; Case Code (Metric): 0603; Size Code: 0201; Min Operating Temperature: -55°C; Max Operating Temperature: 125°C; Tolerance: 1%; Resistor Type: Thick Film; Packaging: Tape and Reel; Package Quantity: 10000; Termination: SMD/SMT; Number of Terminations: 2; Max Power Dissipation: 50mW; Voltage Rating (DC): 25V; Features: Moisture Resistant; Series: RC; Resistance Tolerance: 1%; Construction: Rectangular; Length: 0.024inch; Width: 0.012inch; Height: 0.01inch; Depth: 0.3mm; REACH SVHC: No SVHC; Military Standard: Not; Lead Free: Lead Free; RoHS Compliant: Yes; ComponentLink1URL: https://datasheet.ciiva.com/7660/1421516-7660806.pdf?src-supplier=Element14; ComponentLink1Description: https://datasheet.ciiva.com/7660/1421516-7660806.pdf?src-supplier=Element14; ComponentLink2URL: https://datasheet.ciiva.com/22698/1563626-22698495.pdf?src-supplier=Element14; ComponentLink2Description: https://datasheet.ciiva.com/22698/1563626-22698495.pdf?src-supplier=Element14; ComponentLink3URL: https://datasheet.ciiva.com/46391/1421516-46391338.pdf?src-supplier=Element14; ComponentLink3Description: https://datasheet.ciiva.com/46391/1421516-46391338.pdf?src-supplier=Element14; ComponentLink4URL: https://datasheet.ciiva.com/2493/pyu-r-int-thick-7-2493770.pdf?src-supplier=Digi-Key; ComponentLink4Description: https://datasheet.ciiva.com/2493/pyu-r-int-thick-7-2493770.pdf?src-supplier=Digi-Key; ComponentLink5URL: https://datasheet.ciiva.com/2493/pyu-r-int-thick-7-2493771.pdf?src-supplier=Digi-Key; ComponentLink5Description: https://datasheet.ciiva.com/2493/pyu-r-int-thick-7-2493771.pdf?src-supplier=Digi-Key; ComponentLink6URL: https://datasheet.ciiva.com/2493/pyu-r-int-thick-7-2493769.pdf?src-supplier=Digi-Key; ComponentLink6Description: https://datasheet.ciiva.com/2493/pyu-r-int-thick-7-2493769.pdf?src-supplier=Digi-Key; ComponentLink7URL: https://datasheet.ciiva.com/26829/getdatasheetpartid-420441-26829850.pdf?src-supplier=Verical; ComponentLink7Description: https://datasheet.ciiva.com/26829/getdatasheetpartid-420441-26829850.pdf?src-supplier=Verical; Supplier Part Number 1: 311-100KMCT-ND; LCSC Part Number: C106224
R6-R14 R24 R28 R33 = RC0201JR-070RL: RES SMD 0 OHM JUMPER 1/20W 0201; Manufacturer: Yageo; Power Rating: 50mW; Tolerance: 5%; Voltage Rating: 25V; Supplier 1: Digi-Key; Manufacturer Part Number: RC0201JR-070RL; RoHS: Yes; Category: Chip SMD Resistors; Stock 1: 11079; Pricing 1: 1=0.10000, 10=0.03600, 25=0.02640, 50=0.02000, 100=0.01480, 250=0.01128, 500=0.00904, 1000=0.00665, 5000=0.00477 (USD); Case/Package: 0201; Contact Plating: Tin,Matte; Case Code (Metric): 0603; Case Code (Imperial): 0201; Weight: 6E-06oz; Size Code: 0201; Min Operating Temperature: -55°C; Max Operating Temperature: 125°C; Resistor Type: Thick Film; Resistance: 0R; Packaging: Tape and Reel; Package Quantity: 10000; Number of Terminations: 2; Termination: SMD/SMT; Max Power Dissipation: 50mW; Voltage Rating (DC): 25V; Features: Moisture Resistant; Series: RC; Construction: Rectangular; Resistance Tolerance: 5%; Length: 0.6mm; Width: 0.012inch; Height: 0.01inch; Depth: 0.3mm; Radiation Hardening: No; RoHS Compliant: Yes; REACH SVHC: Unknown; Military Standard: Not; Lead Free: Lead Free; ComponentLink1URL: https://datasheet.ciiva.com/7672/1563626-7672247.pdf?src-supplier=Element14; ComponentLink1Description: https://datasheet.ciiva.com/7672/1563626-7672247.pdf?src-supplier=Element14; ComponentLink2URL: https://datasheet.ciiva.com/7660/1421516-7660808.pdf?src-supplier=Element14; ComponentLink2Description: https://datasheet.ciiva.com/7660/1421516-7660808.pdf?src-supplier=Element14; ComponentLink3URL: https://datasheet.ciiva.com/7672/1563626-7672248.pdf?src-supplier=Element14; ComponentLink3Description: https://datasheet.ciiva.com/7672/1563626-7672248.pdf?src-supplier=Element14; ComponentLink4URL: https://datasheet.ciiva.com/16855/pyu-rc0201-51-rohs-l-8-16855994.pdf?src-supplier=Avnet+Europe; ComponentLink4Description: https://datasheet.ciiva.com/16855/pyu-rc0201-51-rohs-l-8-16855994.pdf?src-supplier=Avnet+Europe; ComponentLink5URL: https://datasheet.ciiva.com/28419/pyu-rc0201-51-rohs-l-8-28419660.pdf?src-supplier=Avnet+Europe; ComponentLink5Description: https://datasheet.ciiva.com/28419/pyu-rc0201-51-rohs-l-8-28419660.pdf?src-supplier=Avnet+Europe; ComponentLink6URL: https://datasheet.ciiva.com/46391/1421516-46391340.pdf?src-supplier=Element14; ComponentLink6Description: https://datasheet.ciiva.com/46391/1421516-46391340.pdf?src-supplier=Element14; ComponentLink7URL: https://datasheet.ciiva.com/8896/pyu-rc0201-51-rohs-l-8-8896143.pdf?src-supplier=Avnet; ComponentLink7Description: https://datasheet.ciiva.com/8896/pyu-rc0201-51-rohs-l-8-8896143.pdf?src-supplier=Avnet; Supplier Part Number 1: 311-0.0NCT-ND; LCSC Part Number: C106228
R15 R19 = RC0201FR-071KL: RES 1K OHM 1% 1/20W 0201; Manufacturer: Yageo; Value: 1kR; Temperature Coefficient: 200ppm/°C; Power Rating: 50mW; Voltage Rating: 25V; Item Type: Resistor; Supplier: Digi-Key; Supplier Part Number: 311-1KMCT-ND; Manufacturer Part Number: RC0201FR-071KL; RoHS: Yes; Category: Chip SMD Resistors; Stock: 5606340; Pricing: 1=0.1, 10=0.027, 50=0.0172, 100=0.0143, 500=0.00988, 1000=0.00854, 5000=0.00629 (USD); Case/Package: 0201; Contact Plating: Tin,Matte; Case Code (Metric): 0603; Case Code (Imperial): 0201; Min Operating Temperature: -55°C; Max Operating Temperature: 125°C; Tolerance: 1%; Resistor Type: Thick Film; Package Quantity: 10000; Packaging: Tape and Reel; Number of Terminations: 2; Termination: SMD/SMT; Max Power Dissipation: 50mW; Working Voltage: 25V; Features: Moisture Resistant; Series: RC; Resistance Tolerance: 1%; Technology: THICK FILM; Construction: Rectangular; Voltage Rating (DC): 25V; Length: 0.024inch; Width: 0.012inch; Height: 0.01inch; Depth: 0.3mm; Military Standard: Not; RoHS Compliant: Yes; Reach SVHC Compliant: Unknown; Lead Free: 5697LeadFree; ComponentLink1URL: https://datasheet.ciiva.com/7672/1563626-7672204.pdf?src-supplier=Element14; ComponentLink1Description: https://datasheet.ciiva.com/7672/1563626-7672204.pdf?src-supplier=Element14; ComponentLink2URL: https://datasheet.ciiva.com/22698/1563626-22698505.pdf?src-supplier=Element14; ComponentLink2Description: https://datasheet.ciiva.com/22698/1563626-22698505.pdf?src-supplier=Element14; ComponentLink3URL: https://datasheet.ciiva.com/29721/pyu-r-int-thick-7-29721196.pdf?src-supplier=Digi-Key; ComponentLink3Description: https://datasheet.ciiva.com/29721/pyu-r-int-thick-7-29721196.pdf?src-supplier=Digi-Key; ComponentLink4URL: https://datasheet.ciiva.com/29721/pyu-r-int-thick-7-29721195.pdf?src-supplier=Digi-Key; ComponentLink4Description: https://datasheet.ciiva.com/29721/pyu-r-int-thick-7-29721195.pdf?src-supplier=Digi-Key; ComponentLink5URL: https://datasheet.ciiva.com/8896/pyu-rc0201-51-rohs-l-8-8896174.pdf?src-supplier=Avnet; ComponentLink5Description: https://datasheet.ciiva.com/8896/pyu-rc0201-51-rohs-l-8-8896174.pdf?src-supplier=Avnet; LCSC Part Number: C138165
R16 = RC0402FR-070RL: RES 0 OHM JUMPER 1/16W 0402; Manufacturer: Yageo; Item Type: Resistors; Resistance: 0R; Tolerance: 1%; Power Rating: 62.5mW; Voltage Rating: 50V; Temperature Coefficient: 200ppm/°C; Max Power Dissipation: 63mW; Supplier 1: Mouser; Manufacturer Part Number: RC0402FR-070RL; RoHS: Yes; Stock 1: 8556842; Pricing 1: 1=0.10000, 10=0.01400, 50=0.01400, 100=0.00600, 1000=0.00300, 5000=0.00200, 10000=0.00100 (USD); Mount: Surface Mount; Case/Package: 0402; Contact Plating: Tin,Matte; Case Code (Imperial): 0402; Case Code (Metric): 1005; Size Code: 0402; Min Operating Temperature: -55°C; Max Operating Temperature: 155°C; Resistor Type: Thick Film; Packaging: Tape and Reel; Termination: SMD/SMT; Features: Moisture Resistant; Series: RC; Number of Terminations: 2; Length: 1mm; Width: 0.5mm; Height: 0.35mm; Radiation Hardening: No; Lead Free: Lead Free; RoHS Compliant: Yes; ComponentLink1URL: https://datasheet.ciiva.com/8896/pyu-rc0402-51-rohs-l-6-8896149.pdf?src-supplier=Avnet; ComponentLink1Description: https://datasheet.ciiva.com/8896/pyu-rc0402-51-rohs-l-6-8896149.pdf?src-supplier=Avnet; ComponentLink2URL: https://datasheet.ciiva.com/16790/pyu-rc0402-51-rohs-l-6-r-16790444.pdf?src-supplier=Future+Electronics; ComponentLink2Description: https://datasheet.ciiva.com/16790/pyu-rc0402-51-rohs-l-6-r-16790444.pdf?src-supplier=Future+Electronics; Supplier Part Number 1: 603-RC0402FR-070RL; LCSC Part Number: C106231
R17 R18 R38 = RC0402FR-07120RL: RES 120 OHM 1% 1/16W 0402; Manufacturer: Yageo; Item Type: Resistors; Power Rating: 62.5mW; Voltage Rating: 50V; Temperature Coefficient: 100ppm/°C; Max Power Dissipation: 63mW; Supplier: Future Electronics; Supplier Part Number: 4529079; Manufacturer Part Number: RC0402FR-07120RL; RoHS: Yes; Stock: 150000; Pricing: 10000=0.0012, 100000=0.0011, 300000=0.001, 750000=0.001, 2000000=0.0009 (USD); Lead Free: 5697LeadFree; ComponentLink1URL: https://datasheet.ciiva.com/12667/pyu-rc0402-51-rohs-l-6-r-12667958.pdf?src-supplier=Mouser; ComponentLink1Description: https://datasheet.ciiva.com/12667/pyu-rc0402-51-rohs-l-6-r-12667958.pdf?src-supplier=Mouser; ComponentLink2URL: https://datasheet.ciiva.com/7849/1018594-7849831.pdf?src-supplier=Element14; ComponentLink2Description: https://datasheet.ciiva.com/7849/1018594-7849831.pdf?src-supplier=Element14; LCSC Part Number: C114758; Case/Package: 0402; Case Code (Imperial): 0402; Case Code (Metric): 1005; Min Operating Temperature: -55°C; Max Operating Temperature: 155°C; Package Quantity: 1; Value: 120R; Tolerance: 1%; Packaging: Tape and Reel; Termination: SMD/SMT; Resistor Type: Thick Film; Number of Terminations: 2; Features: Moisture Resistant; Series: RC; Resistance Tolerance: 1%; Construction: Rectangular; Technology: THICK FILM; Voltage Rating (AC): 50V; Length: 0.039inch; Width: 0.02inch; Height: 0.016inch; Depth: 0.5mm; Reach SVHC Compliant: No; Military Standard: Not; RoHS Compliant: Yes
R21 R22 = RC0201FR-071ML: RES 1M OHM 1% 1/20W 0201; Manufacturer: Yageo; Item Type: Resistor; Value: 1MR; Temperature Coefficient: 200ppm/°C; Power Rating: 50mW; Voltage Rating: 25V; Supplier: Avnet; LCSC Part Number: C295786; Manufacturer Part Number: RC0201FR-071ML; RoHS: Yes; Stock: 13025; Pricing: 1=0.104, 25=0.016, 100=0.008, 250=0.007, 1000=0.006 (USD); Case/Package: 0201; Contact Plating: Tin,Matte; Case Code (Imperial): 0201; Case Code (Metric): 0603; Min Operating Temperature: -55°C; Max Operating Temperature: 125°C; Tolerance: 1%; Resistor Type: Thick Film; Packaging: Tape and Reel; Package Quantity: 10000; Termination: SMD/SMT; Number of Terminations: 2; Max Power Dissipation: 50mW; Features: Moisture Resistant; Series: RC; Resistance Tolerance: 1%; Construction: Rectangular; Voltage Rating (DC): 25V; Length: 0.6mm; Width: 0.3mm; Height: 0.01inch; Depth: 0.3mm; Military Standard: Not; RoHS Compliant: Yes; Reach SVHC Compliant: Unknown; Lead Free: 5697LeadFree; ComponentLink1URL: https://datasheet.ciiva.com/29721/pyu-r-int-thick-7-29721005.pdf?src-supplier=Digikey; ComponentLink1Description: https://datasheet.ciiva.com/29721/pyu-r-int-thick-7-29721005.pdf?src-supplier=Digikey; ComponentLink2URL: https://datasheet.ciiva.com/29721/pyu-r-int-thick-7-29721006.pdf?src-supplier=Digikey; ComponentLink2Description: https://datasheet.ciiva.com/29721/pyu-r-int-thick-7-29721006.pdf?src-supplier=Digikey; ComponentLink3URL: https://datasheet.ciiva.com/7672/1563626-7672207.pdf?src-supplier=Element14; ComponentLink3Description: https://datasheet.ciiva.com/7672/1563626-7672207.pdf?src-supplier=Element14; ComponentLink4URL: https://datasheet.ciiva.com/22698/1563626-22698507.pdf?src-supplier=Element14; ComponentLink4Description: https://datasheet.ciiva.com/22698/1563626-22698507.pdf?src-supplier=Element14; ComponentLink5URL: https://datasheet.ciiva.com/25647/pyu-r-int-thick-7-25647311.pdf?src-supplier=Digikey; ComponentLink5Description: https://datasheet.ciiva.com/25647/pyu-r-int-thick-7-25647311.pdf?src-supplier=Digikey
R29 = RT0402BRE0747KL: RES SMD 47K OHM 0.1% 1/16W 0402; Manufacturer: Yageo; Power Rating: 62.5mW; Voltage Rating (DC): 50V; Value: 47kR; Max Power Dissipation: 63mW; Temperature Coefficient: 50ppm/°C; Item Type: Resistor; Supplier: Digikey; Supplier Part Number: YAG4391CT-ND; Manufacturer Part Number: RT0402BRE0747KL; RoHS: Yes; Category: Chip SMD Resistors; Stock: 11654; Pricing: 1=0.16, 10=0.121, 50=0.0958, 100=0.0858, 500=0.06536, 1000=0.05776, 5000=0.0428 (USD); Case/Package: 0402; Case Code (Metric): 3668CaseCodeMetric; Min Operating Temperature: -55°C; Max Operating Temperature: 155°C; Tolerance: 0.1%; Series: RT; Number of Terminations: 2; Voltage Rating: 50V; Length: 1mm; Width: 500um; Height: 350um; Lead Free: Lead Free; RoHS Compliant: Yes; ComponentLink1URL: https://datasheet.octopart.com/RT0402BRE0747KL-Yageo-datasheet-169971040.pdf?src-supplier=Future+Electronics; ComponentLink1Description: https://datasheet.octopart.com/RT0402BRE0747KL-Yageo-datasheet-169971040.pdf?src-supplier=Future+Electronics; ComponentLink2URL: http://www.yageo.com/documents/recent/PYu-RT_1-to-0.01_RoHS_L_9.pdf?src-supplier=Digikey; ComponentLink2Description: http://www.yageo.com/documents/recent/PYu-RT_1-to-0.01_RoHS_L_9.pdf?src-supplier=Digikey; ComponentLink3URL: https://www.yageo.com/upload/media/product/productsearch/datasheet/rchip/PYu-RT_1-to-0.01_RoHS_L_12.pdf?src-supplier=Digikey; ComponentLink3Description: https://www.yageo.com/upload/media/product/productsearch/datasheet/rchip/PYu-RT_1-to-0.01_RoHS_L_12.pdf?src-supplier=Digikey; LCSC Part Number: C853293
R30 = RT0402BRD07150KL: RES 150K OHM 0.1% 1/16W 0402; Manufacturer: Yageo; Item Type: Resistor; Supplier: Future Electronics; Supplier Part Number: 3102901; Manufacturer Part Number: RT0402BRD07150KL; RoHS: Yes; Category: Chip SMD Resistors; Stock: 20000; Pricing: 10000=0.0218, 20000=0.0213, 30000=0.021, 50000=0.0206, 100000=0.0199 (USD); RoHS Compliant: Yes; LCSC Part Number: C852538
R31 R32 R35 R36 = RC0201FR-074K7L: RES 4.7K OHM 1% 1/20W 0201; Manufacturer: Yageo; Item Type: Resistor; Supplier: Future Electronics; Supplier Part Number: 7537285; Manufacturer Part Number: RC0201FR-074K7L; RoHS: Yes; Category: Chip SMD Resistors; Stock: 1610000; Pricing: 10000=0.0014, 50000=0.0013, 250000=0.0013, 750000=0.0012, 2000000=0.0011 (USD); ComponentLink1URL: https://datasheet.ciiva.com/2493/pyu-r-int-thick-7-2493811.pdf?src-supplier=Digi-Key; ComponentLink1Description: https://datasheet.ciiva.com/2493/pyu-r-int-thick-7-2493811.pdf?src-supplier=Digi-Key; ComponentLink2URL: https://datasheet.ciiva.com/2493/pyu-r-int-thick-7-2493812.pdf?src-supplier=Digi-Key; ComponentLink2Description: https://datasheet.ciiva.com/2493/pyu-r-int-thick-7-2493812.pdf?src-supplier=Digi-Key; ComponentLink3URL: https://datasheet.ciiva.com/2493/pyu-r-int-thick-7-2493813.pdf?src-supplier=Digi-Key; ComponentLink3Description: https://datasheet.ciiva.com/2493/pyu-r-int-thick-7-2493813.pdf?src-supplier=Digi-Key; ComponentLink4URL: https://datasheet.ciiva.com/8892/pyu-rc0201-51-rohs-l-8-8892942.pdf?src-supplier=Avnet; ComponentLink4Description: https://datasheet.ciiva.com/8892/pyu-rc0201-51-rohs-l-8-8892942.pdf?src-supplier=Avnet; ComponentLink5URL: https://datasheet.ciiva.com/7672/1563626-7672233.pdf?src-supplier=Element14; ComponentLink5Description: https://datasheet.ciiva.com/7672/1563626-7672233.pdf?src-supplier=Element14; LCSC Part Number: C138135
SB1 = Solder Bridge 0402: Solder Bridge ON; Manufacturer Part Number: Solder Bridge 0402; Item Type: Solder Bridge
SW4 = B3U-1000P: SWITCH TACTILE SPST-NO 0.05A 12V; Manufacturer: Omron; Mechanical Life: 200000Cycles; Operating Force: 1.5N; Throw Configuration: SPST; Current Rating: 50mA; Contact Resistance: 100mR; Illumination Type: Non-Illuminated,Illuminated; Switch Travel: 0.15mm; Switch Function: Off-Mom; Actuator Type: Standard; Actuator Length: 0.4mm; Ratings: Dust Proof,IP40; ComponentLink1URL: http://www.farnell.com/datasheets/60838.pdf?src-supplier=Farnell; ComponentLink1Description: http://www.farnell.com/datasheets/60838.pdf?src-supplier=Farnell; ComponentLink2URL: http://www.farnell.com/datasheets/60838.pdf?src-supplier=Element14; ComponentLink2Description: http://www.farnell.com/datasheets/60838.pdf?src-supplier=Element14; ComponentLink3URL: https://omronfs.omron.com/en_US/ecb/products/pdf/en-b3u.pdf?src-supplier=Digi-Key; ComponentLink3Description: https://omronfs.omron.com/en_US/ecb/products/pdf/en-b3u.pdf?src-supplier=Digi-Key; ComponentLink4URL: http://www.omron.com/ecb/products/pdf/en-b3u.pdf?src-supplier=Digi-Key; ComponentLink4Description: http://www.omron.com/ecb/products/pdf/en-b3u.pdf?src-supplier=Digi-Key; ComponentLink5URL: https://www.distrelec.biz/Web/Downloads/he/et/B3U_eng_datasheet.pdf?mime=application%2Fpdf&src-supplier=Distrelec; ComponentLink5Description: https://www.distrelec.biz/Web/Downloads/he/et/B3U_eng_datasheet.pdf?mime=application%2Fpdf&src-supplier=Distrelec; ComponentLink6URL: http://www.onlinecomponents.com/productFiles/mf-OM/en-b3u.pdf?src-supplier=Onlinecomponents.com; ComponentLink6Description: http://www.onlinecomponents.com/productFiles/mf-OM/en-b3u.pdf?src-supplier=Onlinecomponents.com; Supplier 1: Digi-Key; Manufacturer Part Number: B3U-1000P; Stock 1: 116454; Pricing 1: 1=1, 10=0.961, 25=0.9064, 50=0.7976, 100=0.7251, 250=0.68888, 500=0.67074, 1000=0.52571 (USD); Mount: Surface Mount; Weight: 0.000776oz; Contact Material: Silver; Min Operating Temperature: -25°C; Max Operating Temperature: 70°C; Packaging: Tape and Reel; Voltage Rating (DC): 12V; Package Quantity: 1; Max Current Rating: 50mA; Termination: SMD/SMT; Orientation: Straight; Max Voltage Rating (DC): 12V; Electrical Life: 200000Cycles; Insulation Resistance: 100MR; Contact Current Rating: 50mA; Length: 4mm; Height: 1.2mm; Depth: 2.5mm; Width: 3mm; REACH SVHC: Unknown; Lead Free: Lead Free; ComponentLink7URL: https://www.verical.com/server-webapp/html/getDatasheet?partID=552554&src-supplier=Verical; ComponentLink7Description: https://www.verical.com/server-webapp/html/getDatasheet?partID=552554&src-supplier=Verical; ComponentLink8URL: http://www.farnell.com/datasheets/1685550.pdf?src-supplier=Element14; ComponentLink8Description: http://www.farnell.com/datasheets/1685550.pdf?src-supplier=Element14; ComponentLink9URL: http://www.farnell.com/datasheets/2610940.pdf?src-supplier=Farnell; ComponentLink9Description: http://www.farnell.com/datasheets/2610940.pdf?src-supplier=Farnell; ComponentLink10URL: https://www.alliedelec.com/m/d/4c8a9ef82804fc3c241a13c1e298fd73.pdf?src-supplier=Allied+Electronics; ComponentLink10Description: https://www.alliedelec.com/m/d/4c8a9ef82804fc3c241a13c1e298fd73.pdf?src-supplier=Allied+Electronics; Supplier Part Number 1: SW1020DKR-ND; LCSC Part Number: C231329; Item Type: Switch
TP1-TP7 TP9 TP11-TP13 TP18-TP24 = TEST POINT 0.5mm Dia: Test Point ON; Item Type: Test Point; Manufacturer Part Number: TEST POINT 0.5mm Dia
U1 = SKY65943-11: GNSS Low-Noise Amplifier Front-End Module with Integrated Pre-Filter and Post-Filter; Manufacturer: Skyworks; Note: N.A.; Item Type: Module; Manufacturer Part Number: SKY65943-11; Footprint Doc: MCM-10; Value: SKY65943-11; ComponentLink1URL: http://www.skyworksinc.com/uploads/documents/SKY65943_11_204404F.pdf; ComponentLink1Description: Datasheet; ComponentLink2URL: https://www.digikey.com/product-detail/en/skyworks-solutions-inc/SKY65943-11/863-2032-1-ND; ComponentLink2Description: Supplier link; HelpURL: http://www.skyworksinc.com/Product/3579/SKY65943-11; LatestRevisionDate: 2019-04-16; Published: 2019-04-16; Supplier 1: Digi-Key; Supplier Part Number 1: 863-2032-1-ND; Supplier 2: Mouser; Supplier Part Number 2: 873-SKY65943-11; Author: rsk